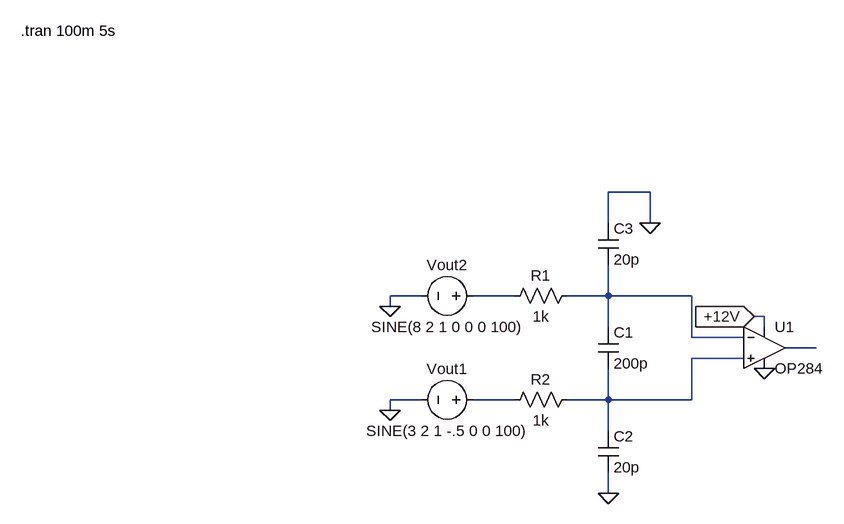
[diagram p0: schematic Draft1.asc]
Draft1.asc, the LTspice schematic file:
Version 4
SHEET 1 892 680
WIRE 624 -16 560 -16
WIRE 560 32 560 -16
WIRE 624 32 624 -16
WIRE 272 144 224 144
WIRE 416 144 352 144
WIRE 560 144 560 96
WIRE 560 144 496 144
WIRE 688 144 560 144
WIRE 224 160 224 144
WIRE 800 176 784 176
WIRE 560 192 560 144
WIRE 800 192 800 176
WIRE 688 208 688 144
WIRE 768 208 688 208
WIRE 880 224 832 224
WIRE 768 240 688 240
WIRE 272 304 224 304
WIRE 416 304 352 304
WIRE 560 304 560 256
WIRE 560 304 496 304
WIRE 688 304 688 240
WIRE 688 304 560 304
WIRE 224 320 224 304
WIRE 560 352 560 304
WIRE 560 448 560 416
FLAG 784 176 +12V
IOPIN 784 176 In
FLAG 800 256 0
FLAG 224 320 0
FLAG 224 160 0
FLAG 560 448 0
FLAG 624 32 0
SYMBOL voltage 368 304 R90
WINDOW 3 32 56 VTop 2
WINDOW 0 -32 56 VBottom 2
SYMATTR Value SINE(3 2 1 -.5 0 0 100)
SYMATTR InstName Vout1
SYMBOL voltage 368 144 R90
WINDOW 0 -32 56 VBottom 2
WINDOW 3 32 56 VTop 2
SYMATTR InstName Vout2
SYMATTR Value SINE(8 2 1 0 0 0 100)
SYMBOL Res 512 128 R90
WINDOW 0 0 56 VBottom 2
WINDOW 3 32 56 VTop 2
SYMATTR InstName R1
SYMATTR Value 1k
SYMBOL Res 512 288 R90
WINDOW 0 0 56 VBottom 2
WINDOW 3 32 56 VTop 2
SYMATTR InstName R2
SYMATTR Value 1k
SYMBOL Cap 544 192 R0
SYMATTR InstName C1
SYMATTR Value 200p
SYMBOL Cap 544 352 R0
SYMATTR InstName C2
SYMATTR Value 20p
SYMBOL Cap 544 32 R0
SYMATTR InstName C3
SYMATTR Value 20p
SYMBOL OpAmps/OP284 800 160 R0
SYMATTR InstName U1
TEXT -344 -264 Left 2 !.tran 100m 5s

The netlist it stands for:
* Draft1.asc
Vout1 N005 0 SINE(3 2 1 -.5 0 0 100)
Vout2 N001 0 SINE(8 2 1 0 0 0 100)
R1 N002 N001 1k
R2 N004 N005 1k
C1 N002 N004 200p
C2 N004 0 20p
C3 0 N002 20p
XU1 N004 N002 +12V 0 N003 OP284  ; pins In+ In- V+ V- OUT
.tran 100m 5s
.lib ADI1.lib
.backanno
.end